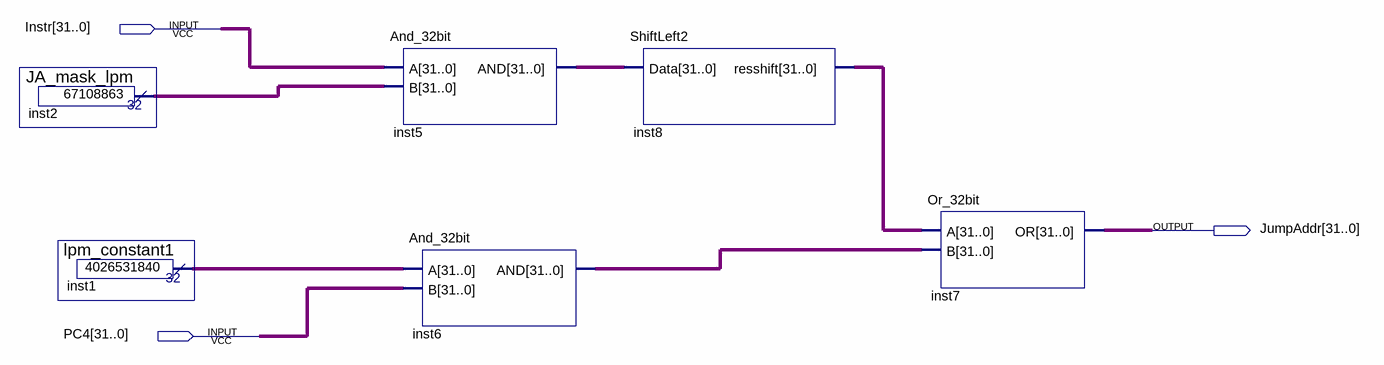
[diagram p0: schematic sheet]
// Quartus schematic JumpAddr.bdf as structural Verilog: 6 symbols, 3 pins
module JumpAddr (
  input  [31:0] Instr,
  input  [31:0] PC4,
  output [31:0] JumpAddr
);

  wire [31:0] inst1_result, inst2_result, inst5_and, inst6_and, inst8_resshift;

  JA_mask_lpm inst2 (.result(inst2_result));
  lpm_constant1 inst1 (.result(inst1_result));
  And_32bit inst5 (.A(Instr), .B(inst2_result), .AND(inst5_and));
  And_32bit inst6 (.A(inst1_result), .B(PC4), .AND(inst6_and));
  ShiftLeft2 inst8 (.Data(inst5_and), .resshift(inst8_resshift));
  Or_32bit inst7 (.A(inst8_resshift), .B(inst6_and), .OR(JumpAddr));
endmodule
